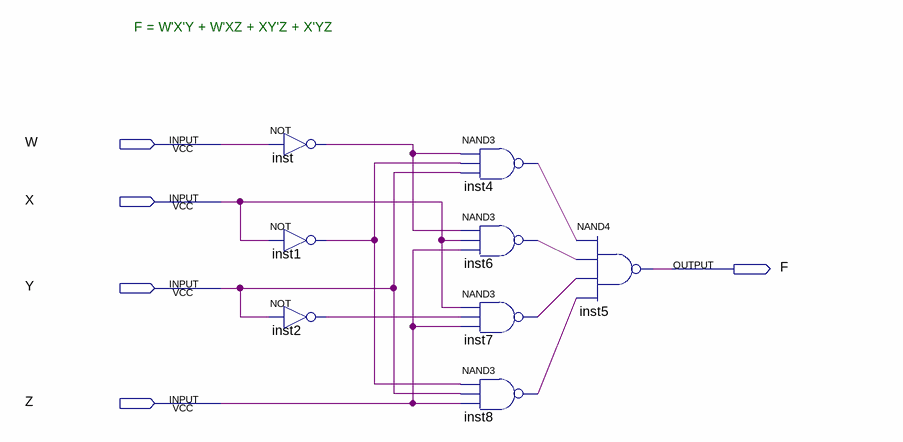
[diagram p0: schematic sheet]
// Quartus schematic Question1_NAND.bdf as structural Verilog: 8 symbols, 5 pins
module Question1_NAND (
  input  W,
  input  X,
  input  Y,
  input  Z,
  output F
);

  wire inst1_out, inst2_out, inst4_out, inst6_out, inst7_out, inst8_out, inst_out;

  not inst (inst_out, W);
  not inst1 (inst1_out, X);
  not inst2 (inst2_out, Y);
  nand inst4 (inst4_out, inst_out, inst1_out, Y);
  nand inst6 (inst6_out, inst_out, X, Z);
  nand inst7 (inst7_out, X, inst2_out, Z);
  nand inst8 (inst8_out, inst1_out, Y, Z);
  nand inst5 (F, inst4_out, inst6_out, inst7_out, inst8_out);

  // Notes on the sheet:
  //   F = W'X'Y + W'XZ + XY'Z + X'YZ            
endmodule
